# Altium schematic sheet Deserializer.SchDoc
size 420 x 297 mm; SheetNumber: 1; SheetTotal: 1
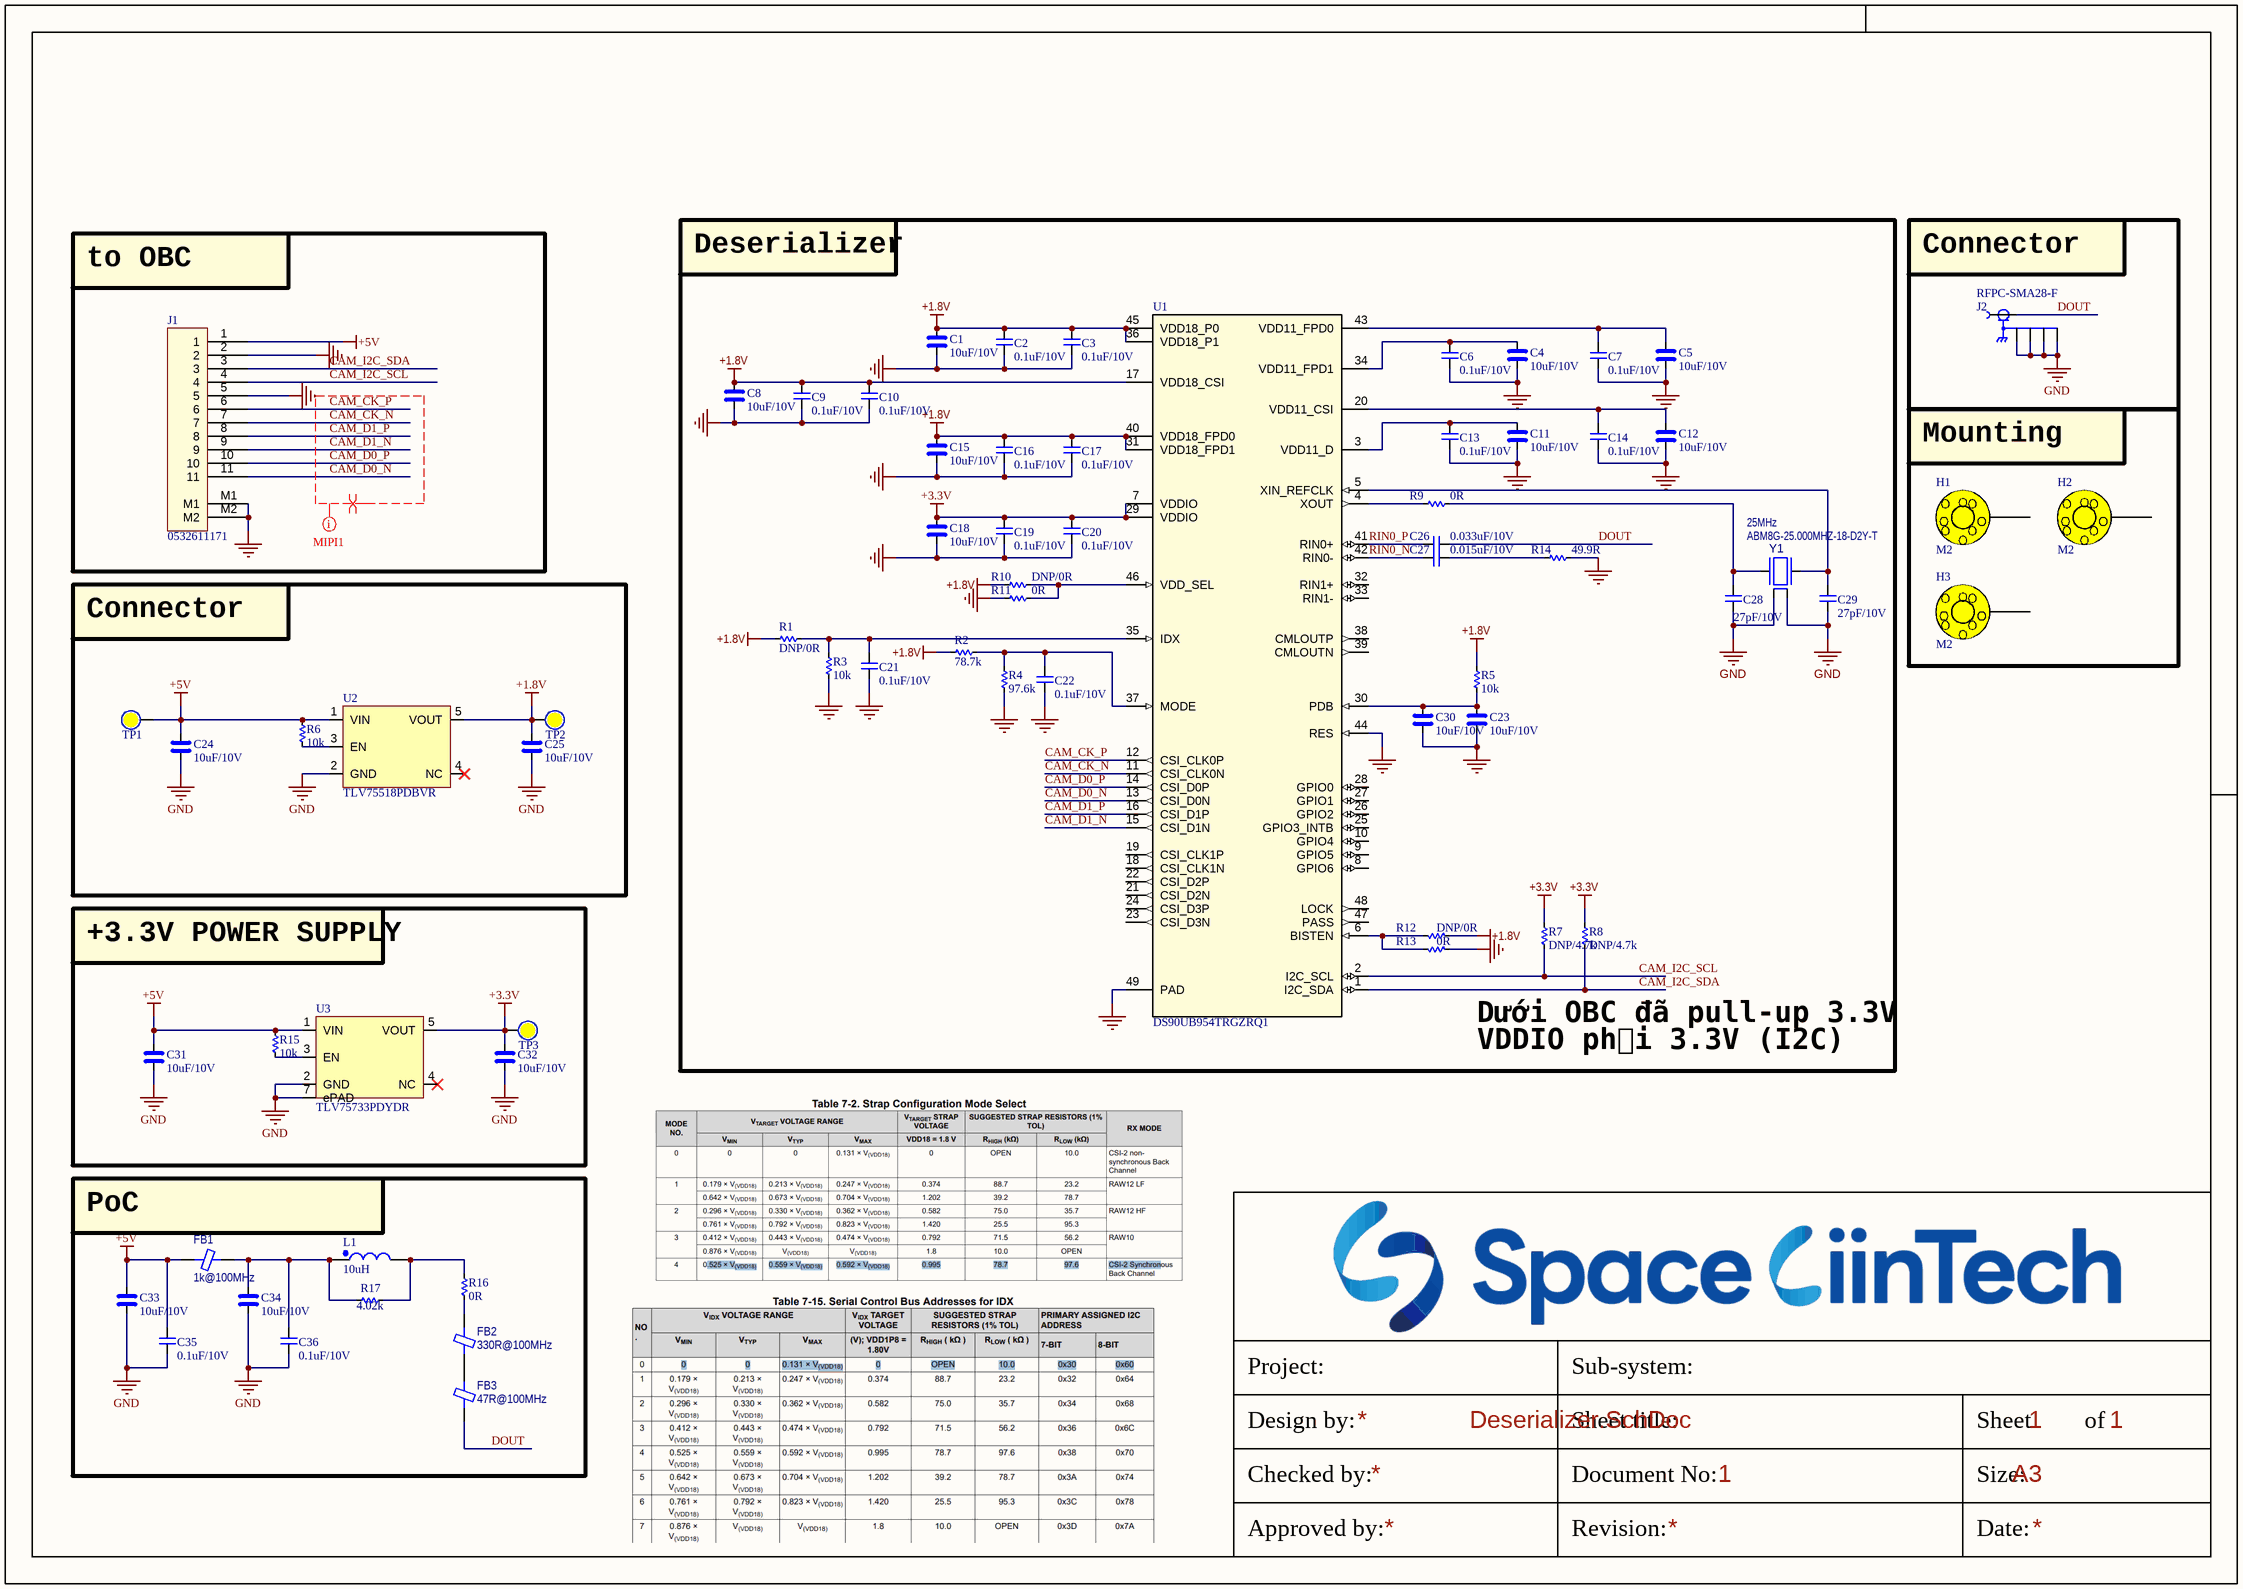
[diagram p0: Deserializer.SchDoc]

## Parts
C1  10uF/10V  [CAP_C_1608X80]
C2  0.1uF/10V  [CAP_C_1608X80]
C3  0.1uF/10V  [CAP_C_1608X80]
C4  10uF/10V  [CAP_C_1608X80]
C5  10uF/10V  [CAP_C_1608X80]
C6  0.1uF/10V  [CAP_C_1608X80]
C7  0.1uF/10V  [CAP_C_1608X80]
C8  10uF/10V  [CAP_C_1608X80]
C9  0.1uF/10V  [CAP_C_1608X80]
C10  0.1uF/10V  [CAP_C_1608X80]
C11  10uF/10V  [CAP_C_1608X80]
C12  10uF/10V  [CAP_C_1608X80]
C13  0.1uF/10V  [CAP_C_1608X80]
C14  0.1uF/10V  [CAP_C_1608X80]
C15  10uF/10V  [CAP_C_1608X80]
C16  0.1uF/10V  [CAP_C_1608X80]
C17  0.1uF/10V  [CAP_C_1608X80]
C18  10uF/10V  [CAP_C_1608X80]
C19  0.1uF/10V  [CAP_C_1608X80]
C20  0.1uF/10V  [CAP_C_1608X80]
C21  0.1uF/10V  [CAP_C_1608X80]
C22  0.1uF/10V  [CAP_C_1608X80]
C23  10uF/10V  [CAP_C_1608X80]
C24  10uF/10V  [CAP_C_1608X80]
C25  10uF/10V  [CAP_C_1608X80]
C26  0.033uF/10V  [CAP_C_1608X80]
C27  0.015uF/10V  [CAP_C_1608X80]
C28  27pF/10V  [CAP_C_1608X80]
C29  27pF/10V  [CAP_C_1608X80]
C30  10uF/10V  [CAP_C_1608X80]
C31  10uF/10V  [CAP_C_1608X80]
C32  10uF/10V  [CAP_C_1608X80]
C33  10uF/10V  [CAP_C_1608X80]
C34  10uF/10V  [CAP_C_1608X80]
C35  0.1uF/10V  [CAP_C_1608X80]
C36  0.1uF/10V  [CAP_C_1608X80]
FB1  1k@100MHz  [IND_C_1608X60]
FB2  330R@100MHz  [IND_C_1608X60]
FB3  47R@100MHz  [IND_C_1608X60]
H1  M2  [HEX-2.2mm]
H2  M2  [HEX-2.2mm]
H3  M2  [HEX-2.2mm]
J1  0532611171  [MOLEX_0532611171]
J2  RFPC-SMA28-F  [GRADCONN_RFPC-SMA28-F]
L1  10uH  [IND300X300X150]
R1  DNP/0R  [RES_C_1608X60]
R2  78.7k  [RES_C_1608X60]
R3  10k  [RES_C_1608X60]
R4  97.6k  [RES_C_1608X60]
R5  10k  [RES_C_1608X60]
R6  10k  [RES_C_1608X60]
R7  DNP/4.7k  [RES_C_1608X60]
R8  DNP/4.7k  [RES_C_1608X60]
R9  0R  [RES_C_1608X60]
R10  DNP/0R  [RES_C_1608X60]
R11  0R  [RES_C_1608X60]
R12  DNP/0R  [RES_C_1608X60]
R13  0R  [RES_C_1608X60]
R14  49.9R  [RES_C_1608X60]
R15  10k  [RES_C_1608X60]
R16  0R  [RES_C_1608X60]
R17  4.02k  [RES_C_1608X60]
TP1  (no value)  [Testpoint_50]  (no BOM)
TP2  (no value)  [Testpoint_50]  (no BOM)
TP3  (no value)  [Testpoint_50]  (no BOM)
U1  DS90UB954TRGZRQ1  [QFN50P700X700X100-48N-EP410x410]
U2  TLV75518PDBVR  [SOT25]
U3  TLV75733PDYDR  [SOT25-EPAD]
Y1  value 25MHz  Manufacturer Part Number 1: ABM8G-25.000MHZ-18-D2Y-T  [CRYSTAL_ABM8G]  (hidden comment: Crystal 4 Pins)

## Blocks framed on the sheet
to OBC: J1
Connector: J2
Mounting: H1-H3
Connector: C24 C25 R6 TP1 TP2 U2
+3.3V POWER SUPPLY: C31 C32 R15 TP3 U3
PoC: C33-C36 FB1-FB3 L1 R16 R17

## Nets
+1.8V: C1.2 C2.2 C3.2 C8.2 C9.2 C10.2 C15.2 C16.2 C17.2 C25.2 R1.2 R2.2 R5.1 R10.1 R12.1 TP2.1 U1.17(VDD18_CSI) U1.31(VDD18_FPD1) U1.36(VDD18_P1) U1.40(VDD18_FPD0) U1.45(VDD18_P0) U2.5(VOUT)
+3.3V: C18.2 C19.2 C20.2 C32.2 R7.1 R8.1 TP3.1 U1.7(VDDIO) U1.29(VDDIO) U3.5(VOUT)
+5V: C24.2 C31.2 C33.2 C35.2 FB1.1 J1.1 R6.1 R15.1 TP1.1 U2.1(VIN) U3.1(VIN)
GND: C1.1 C2.1 C3.1 C4.1 C5.1 C6.1 C7.1 C8.1 C9.1 C10.1 C11.1 C12.1 C13.1 C14.1 C15.1 C16.1 C17.1 C18.1 C19.1 C20.1 C21.1 C22.1 C23.1 C24.1 C25.1 C28.2 C29.2 C30.1 C31.1 C32.1 C33.1 C34.1 C35.1 C36.1 J1.2 J1.5 J1.M1 J1.M2 J2.G1 J2.G2 J2.G3 J2.G4 R3.1 R4.1 R11.1 R13.1 R14.2 U1.44(RES) U1.49(PAD) U2.2(GND) U3.2(GND) U3.7(ePAD) Y1.2(GND) Y1.4(GND)
CAM_CK_N: J1.7 U1.11(CSI_CLK0N)
CAM_CK_P: J1.6 U1.12(CSI_CLK0P)
CAM_D0_N: J1.11 U1.13(CSI_D0N)
CAM_D0_P: J1.10 U1.14(CSI_D0P)
CAM_D1_N: J1.9 U1.15(CSI_D1N)
CAM_D1_P: J1.8 U1.16(CSI_D1P)
CAM_I2C_SCL: J1.4 R7.2 U1.2(I2C_SCL)
CAM_I2C_SDA: J1.3 R8.2 U1.1(I2C_SDA)
DOUT: C26.1 FB3.1 J2.1
RIN0_N: C27.2 U1.42(RIN0-)
RIN0_P: C26.2 U1.41(RIN0+)
NetC4_2: C4.2 C6.2 U1.34(VDD11_FPD1)
NetC5_2: C5.2 C7.2 U1.43(VDD11_FPD0)
NetC11_2: C11.2 C13.2 U1.3(VDD11_D)
NetC12_2: C12.2 C14.2 U1.20(VDD11_CSI)
NetC21_2: C21.2 R1.1 R3.2 U1.35(IDX)
NetC22_2: C22.2 R2.1 R4.2 U1.37(MODE)
NetC23_2: C23.2 C30.2 R5.2 U1.30(PDB)
NetC27_1: C27.1 R14.1
NetC28_1: C28.1 R9.2 Y1.3(Osc2)
NetC29_1: C29.1 U1.5(XIN_REFCLK) Y1.1(Osc1)
NetC34_2: C34.2 C36.2 FB1.2 L1.1 R17.2
NetFB2_1: FB2.1 FB3.2
NetFB2_2: FB2.2 R16.2
NetL1_2: L1.2 R16.1 R17.1
NetR6_2: R6.2 U2.3(EN)
NetR9_1: R9.1 U1.4(XOUT)
NetR10_2: R10.2 R11.2 U1.46(VDD_SEL)
NetR12_2: R12.2 R13.2 U1.6(BISTEN)
NetR15_2: R15.2 U3.3(EN)

Not connected (* = marked no-connect by the designer): H1 1; H2 1; H3 1; U1 8(GPIO6) 9(GPIO5) 10(GPIO4) 18(CSI_CLK1N) 19(CSI_CLK1P) 21(CSI_D2N) 22(CSI_D2P) 23(CSI_D3N) 24(CSI_D3P) 25(GPIO3_INTB) 26(GPIO2) 27(GPIO1) 28(GPIO0) 32(RIN1+) 33(RIN1-) 38(CMLOUTP) 39(CMLOUTN) 47(PASS) 48(LOCK); U2 4(NC)*; U3 4(NC)*

## Layout directives
net class MIPI1: CAM_CK_N, CAM_CK_P, CAM_D0_N, CAM_D0_P, CAM_D1_N, CAM_D1_P
differential pair; net class DIFF100; differential pair class DIFF100: CAM_CK_N, CAM_CK_P, CAM_D0_N, CAM_D0_P, CAM_D1_N, CAM_D1_P

## Notes on the sheet
- Deserializer
- Dưới OBC đã pull-up 3.3V
- VDDIO phải 3.3V (I2C)
- Project:
- Sub-system:
- Design by:
- Sheet title:
- Sheet
- of
- Checked by:
- Approved by:
- Revision:
- Document No:
- Size:
- Date:
- A3

## Library data of the parts
C1 C4 C5 C8 C11 C12 C15 C18 C23-C25 C30-C34 = _CAP_C_High_2: CAP High Value
C2 C3 C6 C7 C9 C10 C13 C14 C16 C17 C19-C22 C26-C29 C35 C36 = _CAP_C_2: CAP
FB1-FB3 = BLM18AG601SN1D: FERRITE BEAD 600 OHM 0603 1LN; Manufacturer: Murata Electronics; Current Rating (Max): 500mA; DC Resistance (DCR) (Max): 380mOhm; Impedance @ Frequency: 600 Ohms @ 100 MHz; Number of Lines: 1; Value: 600 Ohms @ 100 MHz; Part Number: BLM18AG601SN1D; ComponentLink1Description: Datasheet; ComponentLink1URL: https://www.murata.com/en-us/products/productdata/8796738650142/ENFA0003.pdf; ComponentLink2Description: DigiKey Link; ComponentLink2URL: https://www.digikey.com/en/products/detail/murata-electronics/BLM18AG601SN1D/584225; Device Package: 0603 (1608 Metric); Height (Max): 0.037" (0.95mm); LastUpdated: 7/10/2022 9:43:27 AM; Lifecycle Status: Active; Minimum Order: 1; Mounting Type: Surface Mount; Operating Temperature: -55°C ~ 125°C; Package / Case: 0603 (1608 Metric); Packaging: TapeAndReel; PartId: 848; Part Status: Active; Price: 0.02; Series: EMIFIL®, BLM18; Size / Dimension: 0.063" L x 0.032" W (1.60mm x 0.80mm); Supplier 1: DigiKey; Supplier Part Number 1: 490-1014-1-ND
H1-H3 = HEX-M3
J1 = Header 11x1_2M
J2 = RFPC-SMA28-F: SMA Connector Jack, Female Socket 50 Ohms Panel Mount, Through Hole Solder; MF: GradConn; SnapEDA_Link: https://www.snapeda.com/parts/RFPC-SMA28-F/GradConn/view-part/?ref=snap; Package: None; Value: *; MP: RFPC-SMA28-F; Check_prices: https://www.snapeda.com/parts/RFPC-SMA28-F/GradConn/view-part/?ref=eda
L1 = _IND
R1-R17 = _RES_B_2: RES
TP1-TP3 = Test Point: Solder: NF
U1 = IC_Deserializer_DS90UB954TRGZRQ1: Dual 2 MP FPD-Link III deserializer with CSI-2 outputs for 2MP/60fps cameras & radar 48-VQFN -40 to 105; Manufacturer_Name: Texas Instruments; TYPE: TYPE; RefDes: RefDes; Copyright: Copyright (C) 2026 Ultra Librarian. All rights reserved.; Manufacturer_Part_Number: DS90UB954TRGZRQ1; Datasheet: https://www.ti.com/lit/gpn/ds90ub954-q1
U2 = IC_POWER_AP7347DQ
U3 = IC_POWER_TLV75733PDYDR
Y1 = OSC_24MHz: Crystal; Manufacturer 1: Abracon Corporation; MCHP-ID: OSC1047; Description_: CRYSTAL 24MHz 18pF SMD ABM8G; Dev Tools Status: Production; Owner: Mark Loper; Populated: DNP; Revision: 1; Symbol: Crystal 4 Pins; Status: MCL Design; ComponentLink1URL: https://chn-vm-apps.microchip.com/mchprepo/parts/Datasheets/ABM8G.pdf; ComponentLink1Description: SVN Datasheet; ComponentLink2URL: C:\ALTIUM_WORK\00001_MCHP-CDB\Datasheets\ABM8G.pdf; ComponentLink2Description: Local Datasheet; ComponentLink3URL: C:\ALTIUM_WORK\00001_MCHP-CDB\Library\LibraryRefs\Crystal 4 Pins.SchLib; ComponentLink3Description: Open Symbol; ComponentLink4URL: C:\ALTIUM_WORK\00001_MCHP-CDB\Library\Footprints\CRYSTAL_ABM8G.PcbLib; ComponentLink4Description: Open Footprint; ComponentLink5Description: Open Footprint 2; ComponentLink6Description: Open Footprint 3; ComponentLink7Description: Open Footprint 4; Package: ABM8G; Type: Crystal; Category: Crystal/Oscillator; Supplier 1: Digi-Key; Supplier Part Number 1: 535-10273-1-ND; Quantity Override: 1